# Altium schematic sheet BNO085.SchDoc
size A4; SheetNumber: 2; SheetTotal: 9
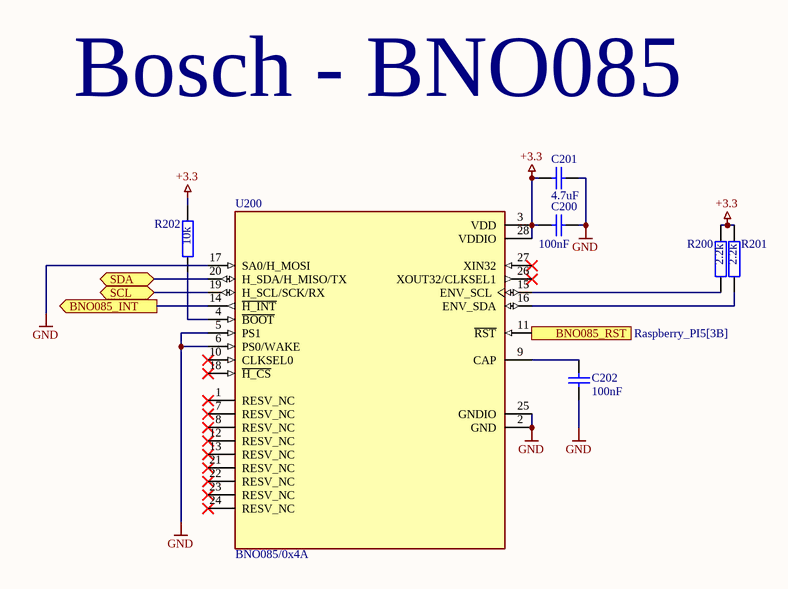
[diagram p0: BNO085.SchDoc]

## Parts
C200  value 100nF  [0603]  (hidden comment: 0603)
C201  value 4.7uF  [0603]  (hidden comment: 0603)
C202  value 100nF  [0603]  (hidden comment: 0603)
R200  value 2.2k  [0603]  (hidden comment: 0603)
R201  value 2.2k  [0603]  (hidden comment: 0603)
R202  value 10k  [0603]  (hidden comment: 0603)
U200  BNO085/0x4A  [IC_BNO085]

## Ports
BNO085_INT (out, see Raspberry_PI5[3B]), BNO085_RST (in, see Raspberry_PI5[3B]), SCL (bidir, see LSM6DSO[2B], PCA9685[2B], Raspberry_PI5[2B], Test_Sensor_Connectoren[1D], Test_Sensor_Connectoren[2D]), SDA (bidir, see LSM6DSO[2B], PCA9685[2B], Raspberry_PI5[2B], Test_Sensor_Connectoren[1C], Test_Sensor_Connectoren[2D])

## Nets
+3.3: C200.1 C201.1 R200.2 R201.2 R202.2 U200.3(VDD) U200.28(VDDIO)
GND: C200.2 C201.2 C202.2 U200.2(GND) U200.5(PS1) U200.6(PS0/WAKE) U200.17(SA0/H_MOSI) U200.25(GNDIO)
BNO085_INT: U200.14(~{H_INT}) ; port BNO085_INT
BNO085_RST: U200.11(~{RST}) ; port BNO085_RST
SCL: U200.19(H_SCL/SCK/RX) ; port SCL
SDA: U200.20(H_SDA/H_MISO/TX) ; port SDA
NetC202_1: C202.1 U200.9(CAP)
NetR200_1: R200.1 U200.15(ENV_SCL)
NetR201_1: R201.1 U200.16(ENV_SDA)
NetR202_1: R202.1 U200.4(~{BOOT})

Not connected (* = marked no-connect by the designer): U200 1(RESV_NC)* 7(RESV_NC)* 8(RESV_NC)* 10(CLKSEL0)* 12(RESV_NC)* 13(RESV_NC)* 18(~{H_CS})* 21(RESV_NC)* 22(RESV_NC)* 23(RESV_NC)* 24(RESV_NC)* 26(XOUT32/CLKSEL1)* 27(XIN32)*

## Notes on the sheet
- Bosch - BNO085

## Library data of the parts
C200-C202 = KO: Kondensator
R200-R202 = RES: Widerstand
U200 = BNO085: Accelerometer, Gyroscope, Magnetometer, 9 Axis Sensor IÂ²C, SPI, UART Output; MF: Hillcrest Laboratories,; SnapEDA_Link: https://www.snapeda.com/parts/BNO085/Hillcrest+Laboratories%252C+Inc./view-part/?ref=snap; Package: TFLGA-28 Hillcrest Laboratories; Value: *; MP: BNO085; Check_prices: https://www.snapeda.com/parts/BNO085/Hillcrest+Laboratories%252C+Inc./view-part/?ref=eda